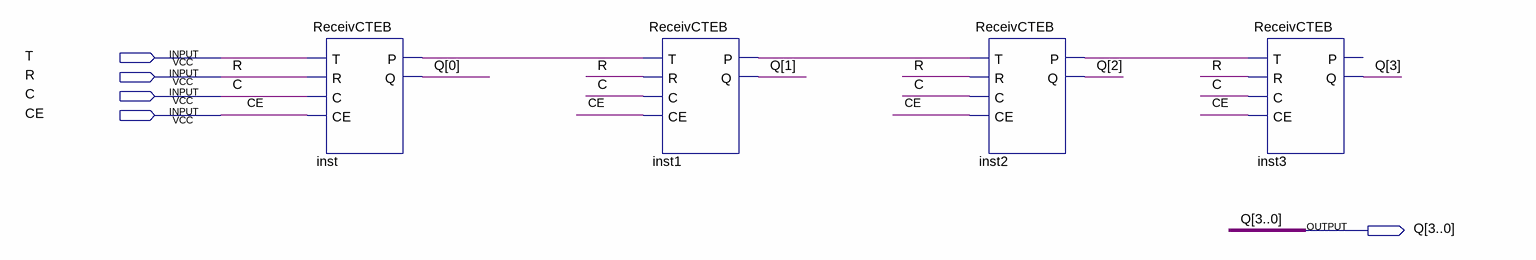
[diagram p0: schematic sheet]
// Quartus schematic ReceivCT4.bdf as structural Verilog: 4 symbols, 5 pins
module ReceivCT4 (
  input  T,
  input  R,
  input  C,
  input  CE,
  output [3:0] Q
);

  wire inst1_p, inst2_p, inst_p;

  ReceivCTEB inst (.T(T), .R(R), .C(C), .CE(CE), .P(inst_p), .Q(Q[0]));
  ReceivCTEB inst1 (.T(inst_p), .R(R), .C(C), .CE(CE), .P(inst1_p), .Q(Q[1]));
  ReceivCTEB inst2 (.T(inst1_p), .R(R), .C(C), .CE(CE), .P(inst2_p), .Q(Q[2]));
  ReceivCTEB inst3 (.T(inst2_p), .R(R), .C(C), .CE(CE), .Q(Q[3]));  // open: P
endmodule
